# Altium project Interface-Board-v4.0.PrjPcb (part 2 of 2)

## Sheet Stepper-Sheet.SchDoc
size A4; SheetNumber: 3; SheetTotal: 4
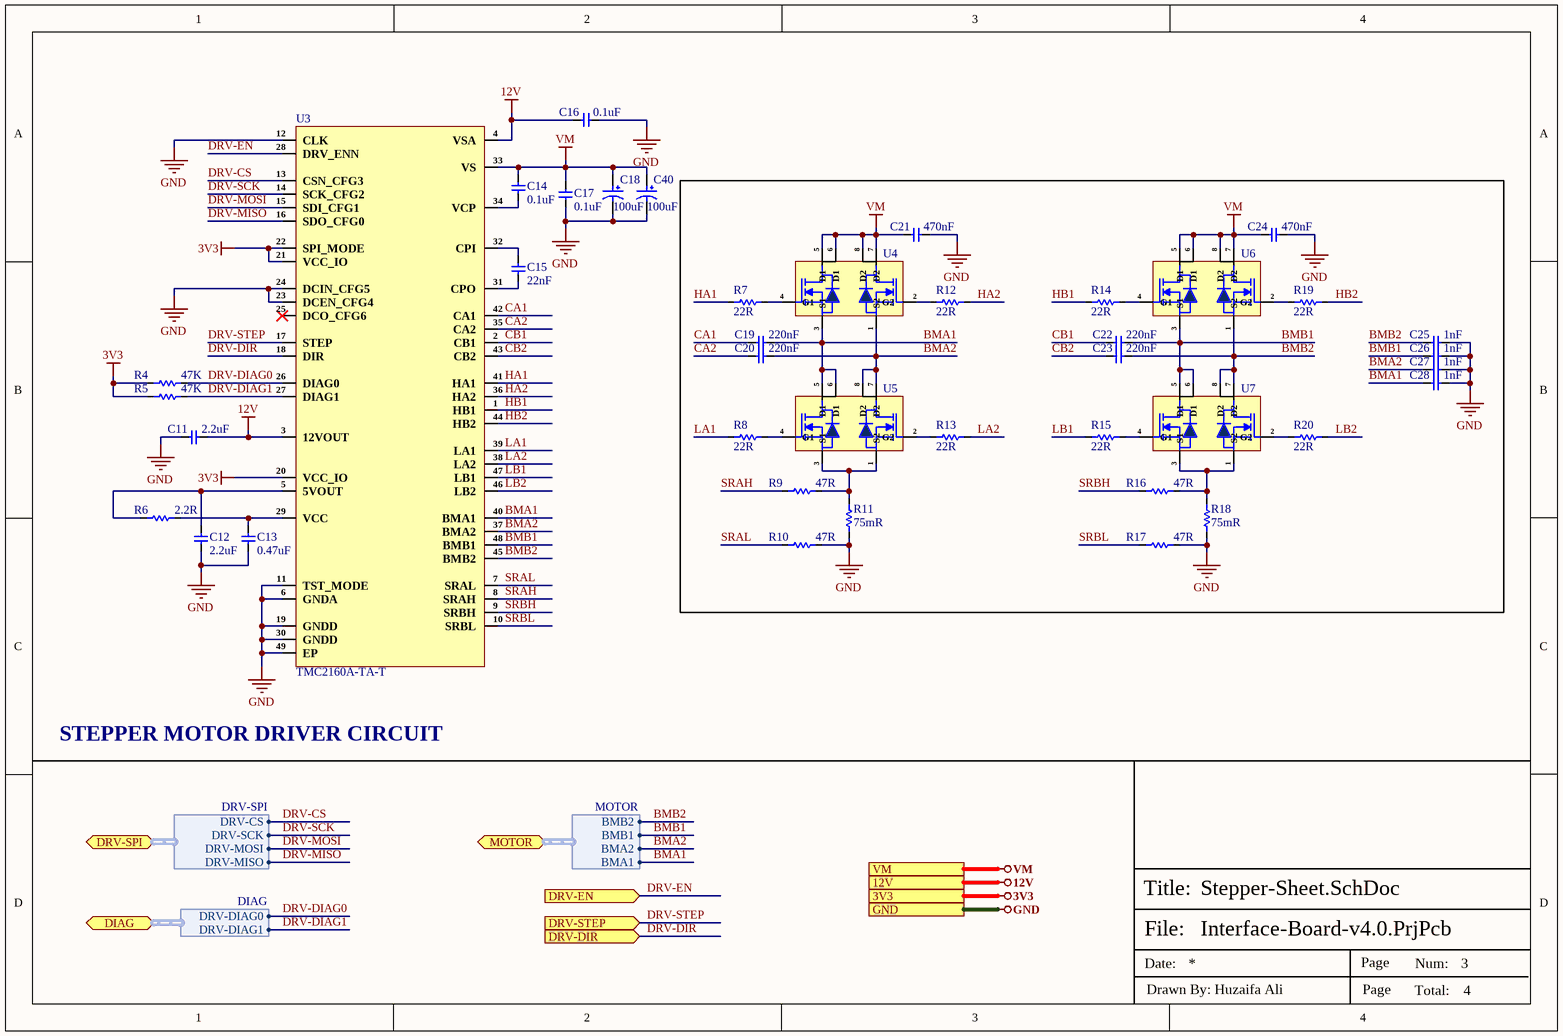
[diagram p2: Stepper-Sheet.SchDoc]

### Parts
C11  2.2uF  [CAP-0603]
C12  2.2uF  [CAP-0603]
C13  0.47uF  [Cap-0603]
C14  0.1uF  [Cap-0603]
C15  22nF  [Cap-0603]
C16  0.1uF  [Cap-0603]
C17  0.1uF  [Cap-0603]
C18  100uF  [RVT1H101M0607]
C19  220nF  [Cap-0603]
C20  220nF  [Cap-0603]
C21  470nF  [Cap-0603]
C22  220nF  [Cap-0603]
C23  220nF  [Cap-0603]
C24  470nF  [Cap-0603]
C25  1nF  [Cap-0603]
C26  1nF  [Cap-0603]
C27  1nF  [Cap-0603]
C28  1nF  [Cap-0603]
C40  100uF  [RVT1H101M0607]
R4  47K  [Res-0201]
R5  47K  [Res-0201]
R6  2.2R  [Res-0402]
R7  22R  [Res-0603]
R8  22R  [Res-0603]
R9  47R  [Res-0603]
R10  47R  [Res-0603]
R11  75mR  [Res-1206]
R12  22R  [Res-0603]
R13  22R  [Res-0603]
R14  22R  [Res-0603]
R15  22R  [Res-0603]
R16  47R  [Res-0603]
R17  47R  [Res-0603]
R18  75mR  [Res-1206]
R19  22R  [Res-0603]
R20  22R  [Res-0603]
U3  TMC2160A-TA-T  [48-TQFP-EP(7x7)]
U4  AOSD62666E  [SOIC-8]  (value not drawn)
U5  AOSD62666E  [SOIC-8]  (value not drawn)
U6  AOSD62666E  [SOIC-8]  (value not drawn)
U7  AOSD62666E  [SOIC-8]  (value not drawn)

### Ports
3V3 (see Top-Sheet[3B], Connector-Sheet[3D], Power-Sheet[3D]), 12V (see Top-Sheet[3B], Connector-Sheet[3D], Power-Sheet[3D]), DIAG (bidir, harness DIAG, see Top-Sheet[3B], Connector-Sheet[1D]), DRV-DIR (in, see Top-Sheet[3B], Connector-Sheet[2D]), DRV-EN (in, see Top-Sheet[3B], Connector-Sheet[2D]), DRV-SPI (bidir, harness DRV-SPI, see Top-Sheet[3B], Connector-Sheet[1D]), DRV-STEP (in, see Top-Sheet[3B], Connector-Sheet[2D]), GND (see Top-Sheet[3B], Connector-Sheet[3D], Power-Sheet[3D]), MOTOR (bidir, harness MOTOR, see Top-Sheet[3B], Connector-Sheet[2D]), VM (see Top-Sheet[3B], Power-Sheet[3D])

### Harnesses
MOTOR: BMB2, BMB1, BMA2, BMA1
DRV-SPI: DRV-CS, DRV-SCK, DRV-MOSI, DRV-MISO
DIAG: DRV-DIAG0, DRV-DIAG1

### Nets
3V3: R4.1 R5.1 U3.20(VCC_IO) U3.21(VCC_IO) U3.22(SPI_MODE) ; port 3V3
12V: C11.2 C16.2 U3.3(12VOUT) U3.4(VSA) ; port 12V
GND: C11.1 C12.1 C13.1 C16.1 C17.1 C18.2 C21.2 C24.2 C25.2 C26.2 C27.2 C28.2 C40.2 R10.2 R11.1 R17.2 R18.1 U3.6(GNDA) U3.11(TST_MODE) U3.12(CLK) U3.19(GNDD) U3.23(DCEN_CFG4) U3.24(DCIN_CFG5) U3.30(GNDD) U3.49(EP) ; port GND
VM: C14.2 C17.2 C18.1 C21.1 C24.1 C40.1 U3.33(VS) U4.5(D1) U4.6(D1) U4.7(D2) U4.8(D2) U6.5(D1) U6.6(D1) U6.7(D2) U6.8(D2) ; port VM
BMA1: C19.2 C28.1 U3.40(BMA1) U4.3(S1) U5.5(D1) U5.6(D1) ; port MOTOR.BMA1
BMA2: C20.2 C27.1 U3.37(BMA2) U4.1(S2) U5.7(D2) U5.8(D2) ; port MOTOR.BMA2
BMB1: C22.2 C26.1 U3.48(BMB1) U6.3(S1) U7.5(D1) U7.6(D1) ; port MOTOR.BMB1
BMB2: C23.2 C25.1 U3.45(BMB2) U6.1(S2) U7.7(D2) U7.8(D2) ; port MOTOR.BMB2
CA1: C19.1 U3.42(CA1)
CA2: C20.1 U3.35(CA2)
CB1: C22.1 U3.2(CB1)
CB2: C23.1 U3.43(CB2)
DRV-CS: U3.13(CSN_CFG3) ; port DRV-SPI.DRV-CS
DRV-DIAG0: R4.2 U3.26(DIAG0) ; port DIAG.DRV-DIAG0
DRV-DIAG1: R5.2 U3.27(DIAG1) ; port DIAG.DRV-DIAG1
DRV-DIR: U3.18(DIR) ; port DRV-DIR
DRV-EN: U3.28(DRV_ENN) ; port DRV-EN
DRV-MISO: U3.16(SDO_CFG0) ; port DRV-SPI.DRV-MISO
DRV-MOSI: U3.15(SDI_CFG1) ; port DRV-SPI.DRV-MOSI
DRV-SCK: U3.14(SCK_CFG2) ; port DRV-SPI.DRV-SCK
DRV-STEP: U3.17(STEP) ; port DRV-STEP
HA1: R7.1 U3.41(HA1)
HA2: R12.2 U3.36(HA2)
HB1: R14.1 U3.1(HB1)
HB2: R19.2 U3.44(HB2)
LA1: R8.1 U3.39(LA1)
LA2: R13.2 U3.38(LA2)
LB1: R15.1 U3.47(LB1)
LB2: R20.2 U3.46(LB2)
SRAH: R9.1 U3.8(SRAH)
SRAL: R10.1 U3.7(SRAL)
SRBH: R16.1 U3.9(SRBH)
SRBL: R17.1 U3.10(SRBL)
NetC12_2: C12.2 R6.1 U3.5(5VOUT)
NetC13_2: C13.2 R6.2 U3.29(VCC)
NetC14_1: C14.1 U3.34(VCP)
NetC15_1: C15.1 U3.31(CPO)
NetC15_2: C15.2 U3.32(CPI)
NetR7_2: R7.2 U4.4(G1)
NetR8_2: R8.2 U5.4(G1)
NetR9_2: R9.2 R11.2 U5.1(S2) U5.3(S1)
NetR12_1: R12.1 U4.2(G2)
NetR13_1: R13.1 U5.2(G2)
NetR14_2: R14.2 U6.4(G1)
NetR15_2: R15.2 U7.4(G1)
NetR16_2: R16.2 R18.2 U7.1(S2) U7.3(S1)
NetR19_1: R19.1 U6.2(G2)
NetR20_1: R20.1 U7.2(G2)

Not connected (* = marked no-connect by the designer): U3 25(DCO_CFG6)*

### Notes on the sheet
- STEPPER MOTOR DRIVER CIRCUIT
- File:
- Title:
- Date:
- Page
- Num:
- Total:
- Drawn By: Huzaifa Ali

### Library data of the parts
C11 C12 = CC0603KRX5R8BB225: CAP CER 2.2UF 25V X5R 0603; Manufacturer: Yageo; Tolerance: 10%; Item Type: Capacitor; Supplier 1: Digi-Key; Manufacturer Part Number: CC0603KRX5R8BB225; Stock 1: 687936; Pricing 1: 1=0.4, 10=0.276, 50=0.1932, 100=0.1656, 500=0.1242, 1000=0.10488 (USD); Mount: Surface Mount; Case/Package: 0603; Case Code (Metric): 1608; Case Code (Imperial): 0603; Weight: 7.1E-05oz; Min Operating Temperature: -55°C; Max Operating Temperature: 85°C; Packaging: Tape and Reel; Capacitance: 2.2uF; Dielectric: X5R; Voltage Rating: 25V; Termination: SMD/SMT; Resistor Type: Ceramic; Voltage Rating (DC): 25V; Package Quantity: 4000; Length: 1.6mm; Width: 0.031inch; Thickness: 0.037inch; Depth: 0.8mm; Radiation Hardening: No; Lead Free: Lead Free; Halogen Free: Halogen Free; RoHS Compliant: Yes; ComponentLink1URL: https://www.verical.com/server-webapp/html/getDatasheet?partID=782757&src-supplier=Verical; ComponentLink1Description: https://www.verical.com/server-webapp/html/getDatasheet?partID=782757&src-supplier=Verical; Supplier Part Number 1: 311-1786-1-ND; LCSC Part Number: C309478
C13 = CC0603KRX5R9BB474: CAP CER 0.47UF 50V X5R 0603; Manufacturer: Yageo; Capacitance: 470nF; Tolerance: 10%; Item Type: Capacitor; Supplier 1: Digi-Key; Manufacturer Part Number: CC0603KRX5R9BB474; RoHS: Yes; Category: Ceramic Capacitors; Stock 1: 15145; Pricing 1: 1=0.45000, 10=0.31400, 50=0.22000, 100=0.18860, 500=0.14144, 1000=0.11944 (USD); Mount: Surface Mount; Case/Package: 0603; Min Operating Temperature: -55°C; Max Operating Temperature: 85°C; Packaging: Tape and Reel; Voltage Rating: 50V; Voltage Rating (DC): 50V; Dielectric: X5R; Length: 0.063inch; Width: 0.031inch; Thickness: 0.035inch; Lead Free: Lead Free; Halogen Free: Halogen Free; RoHS Compliant: Yes; ComponentLink1URL: https://www.mouser.com/ds/2/447/ProductSelectionGuide 2014_Final_2-1131690.pdf?src-supplier=Mouser; ComponentLink1Description: https://www.mouser.com/ds/2/447/ProductSelectionGuide 2014_Final_2-1131690.pdf?src-supplier=Mouser; ComponentLink2URL: http://www.yageo.com/documents/recent/UPY-GPHC_X5R_4V-to-50V_25.pdf?src-supplier=Digi-Key; ComponentLink2Description: http://www.yageo.com/documents/recent/UPY-GPHC_X5R_4V-to-50V_25.pdf?src-supplier=Digi-Key; ComponentLink3URL: http://www.yageo.com/exep/pages/download/literatures/ProductSelectionGuide%202014_Final_2.pdf?src-supplier=Digi-Key; ComponentLink3Description: http://www.yageo.com/exep/pages/download/literatures/ProductSelectionGuide%202014_Final_2.pdf?src-supplier=Digi-Key; Supplier Part Number 1: 311-4047-1-ND; LCSC Part Number: C513651
C14 C16 C17 = CC0603KRX7R0BB104: CAP CER 0.1UF 100V X7R 0603; Manufacturer: Yageo; Capacitance: 100nF; Tolerance: 10%; Item Type: Capacitor; Supplier 1: Digi-Key; Manufacturer Part Number: CC0603KRX7R0BB104; RoHS: Yes; Category: Ceramic Capacitors; Stock 1: 60476; Pricing 1: 1=0.19000, 10=0.13500, 50=0.07680, 100=0.06370, 500=0.04466, 1000=0.03696 (USD); Mount: Surface Mount; Case/Package: 0603; Case Code (Metric): 1608; Case Code (Imperial): 0603; Weight: 7.1E-05oz; Min Operating Temperature: -55°C; Max Operating Temperature: 125°C; Package Quantity: 4000; Voltage Rating: 100V; Packaging: Tape and Reel; Dielectric: X7R; Termination: SMD/SMT; Resistor Type: Ceramic; Voltage Rating (DC): 100V; Series: CC; Length: 0.063inch; Width: 0.031inch; Thickness: 0.035inch; Depth: 0.8mm; Lead Free: Lead Free; RoHS Compliant: Yes; ComponentLink1URL: https://datasheet.ciiva.com/6277/mlccorderingcode-6277030.pdf?src-supplier=Digi-Key; ComponentLink1Description: https://datasheet.ciiva.com/6277/mlccorderingcode-6277030.pdf?src-supplier=Digi-Key; ComponentLink2URL: https://datasheet.ciiva.com/6277/mlccorderingcode-6277081.pdf?src-supplier=Digi-Key; ComponentLink2Description: https://datasheet.ciiva.com/6277/mlccorderingcode-6277081.pdf?src-supplier=Digi-Key; ComponentLink3URL: https://datasheet.ciiva.com/6277/mlccorderingcode-6277082.pdf?src-supplier=Digi-Key; ComponentLink3Description: https://datasheet.ciiva.com/6277/mlccorderingcode-6277082.pdf?src-supplier=Digi-Key; Supplier Part Number 1: 311-1523-1-ND; LCSC Part Number: C113803
C15 = CGA3E2X7R2A223K080AA: CAP CER 0.022UF 100V X7R 0603; Manufacturer: TDK; Tolerance: 10%; Item Type: Capacitor; Supplier 1: Digi-Key; Manufacturer Part Number: CGA3E2X7R2A223K080AA; RoHS: Yes; Category: Ceramic Capacitors; Stock 1: 56079; Pricing 1: 1=0.11000, 10=0.07600, 50=0.04340, 100=0.03590, 500=0.02516, 1000=0.02083 (USD); Mount: Surface Mount; Case/Package: 0603; Case Code (Metric): 1608; Case Code (Imperial): 0603; Weight: 7.1E-05oz; Min Operating Temperature: -55°C; Max Operating Temperature: 125°C; Capacitance: 22nF; Voltage Rating: 100V; Packaging: Tape and Reel; Voltage Rating (DC): 100V; Dielectric: X7R; Termination: SMD/SMT; Series: CGA; Package Quantity: 1; Resistor Type: Ceramic; Length: 1.6mm; Width: 0.031inch; Height: 0.8mm; Thickness: 0.035inch; Depth: 0.8mm; Ratings: AEC-Q200; RoHS Compliant: Yes; REACH SVHC: No SVHC; ComponentLink1URL: https://datasheet.ciiva.com/22725/1735406-22725648.pdf?src-supplier=Element14; ComponentLink1Description: https://datasheet.ciiva.com/22725/1735406-22725648.pdf?src-supplier=Element14; ComponentLink2URL: https://datasheet.ciiva.com/24218/cga3e2x7r2a223k080aa-266292-24218959.pdf?src-supplier=Mouser; ComponentLink2Description: https://datasheet.ciiva.com/24218/cga3e2x7r2a223k080aa-266292-24218959.pdf?src-supplier=Mouser; ComponentLink3URL: https://datasheet.ciiva.com/7975/1807242-7975349.pdf?src-supplier=Element14; ComponentLink3Description: https://datasheet.ciiva.com/7975/1807242-7975349.pdf?src-supplier=Element14; Supplier Part Number 1: 445-5814-1-ND; LCSC Part Number: C2167165
C18 C40 = RVT1H101M0607: 100uF 50V ±20% SMD,D6.3xL7.7mm Aluminum Electrolytic Capacitors - SMD ROHS; Manufacturer: ROQANG; Manufacturer Part Number: RVT1H101M0607; Package: SMD,D6.3xL7.7mm; LCSC Part Number: C3151829; Item Type: Capacitor; ComponentLink1Description: LCSC; ComponentLink1URL: https://www.lcsc.com/product-detail/Aluminum-Electrolytic-Capacitors-SMD_ROQANG-RVT1H101M0607_C3151829.html
C19 C20 C22 C23 = CC0603KRX7R9BB224: CAP CER 0.22 uF, 50 V, ± 10%, X7R, 0603 [1608 Metric]; Manufacturer: Yageo; Material: 4241ConductorMaterial; Voltage Rating: 50V; Item Type: Capacitor; Supplier: Future Electronics; Supplier Part Number: 8068995; Manufacturer Part Number: CC0603KRX7R9BB224; RoHS: Yes; Category: Ceramic Capacitors; Stock: 1468000; Pricing: 4000=0.0134, 12000=0.013, 40000=0.0125, 80000=0.0122, 160000=0.0117 (USD); Mounting Technology: Surface Mount; Case/Package: 0603; Case Code (Imperial): 0603; Case Code (Metric): 1608; Min Operating Temperature: -55°C; Max Operating Temperature: 125°C; Value: 220nF; Packaging: Cut Tape; Tolerance: 10%; Voltage Rating (DC): 50V; Series: CC; Length: 0.063inch; Width: 0.031inch; Height: 900um; Thickness: 0.035inch; Lead Free: Lead Free; Halogen Free: Halogen Free; RoHS Compliant: Yes; ComponentLink1URL: http://www.yageo.com/documents/recent/UPY-GPHC_X7R_6.3V-to-50V_18.pdf?src-supplier=Digi-Key; ComponentLink1Description: http://www.yageo.com/documents/recent/UPY-GPHC_X7R_6.3V-to-50V_18.pdf?src-supplier=Digi-Key; ComponentLink2URL: https://www.yageo.com/upload/media/product/productsearch/datasheet/mlcc/UPY-GPHC_X7R_6.3V-to-50V_18.pdf?src-supplier=Digi-Key; ComponentLink2Description: https://www.yageo.com/upload/media/product/productsearch/datasheet/mlcc/UPY-GPHC_X7R_6.3V-to-50V_18.pdf?src-supplier=Digi-Key; ComponentLink3URL: https://datasheet.octopart.com/CC0603KRX7R9BB224-Yageo-datasheet-140260305.pdf?src-supplier=Newark; ComponentLink3Description: https://datasheet.octopart.com/CC0603KRX7R9BB224-Yageo-datasheet-140260305.pdf?src-supplier=Newark; ComponentLink4URL: https://datasheet.octopart.com/CC0603KRX7R9BB224-Yageo-datasheet-137700082.pdf?src-supplier=Future+Electronics; ComponentLink4Description: https://datasheet.octopart.com/CC0603KRX7R9BB224-Yageo-datasheet-137700082.pdf?src-supplier=Future+Electronics; ComponentLink5URL: https://datasheet.octopart.com/CC0603KRX7R9BB224-Yageo-datasheet-166511530.pdf?src-supplier=Future+Electronics; ComponentLink5Description: https://datasheet.octopart.com/CC0603KRX7R9BB224-Yageo-datasheet-166511530.pdf?src-supplier=Future+Electronics; LCSC Part Number: C107083; ComponentLink6Description: LCSC; ComponentLink6URL: https://www.lcsc.com/product-detail/Multilayer-Ceramic-Capacitors-MLCC-SMD-SMT_YAGEO-CC0603KRX7R9BB224_C107083.html
C21 C24 = CC0603KRX7R9BB474: CAP CER 0.47 uF, 50 V, ± 10%, X7R, 0603 [1608 Metric]; Manufacturer: Yageo; Material: 4241ConductorMaterial; Dielectric: 1511DielectricType; Voltage Rating: 50V; Item Type: Capacitor; Supplier: Future Electronics; Supplier Part Number: 3124150; Manufacturer Part Number: CC0603KRX7R9BB474; RoHS: Yes; Category: Ceramic Capacitors; Stock: 44000; Pricing: 4000=0.0623, 8000=0.0607, 12000=0.0598, 16000=0.0591, 20000=0.0571 (USD); Package: 0603; Min Operating Temperature: -55°C; Max Operating Temperature: 125°C; Value: 470nF; Voltage Rating (DC): 50V; Height: 900um; RoHS Compliant: Yes; Halogen Free: 5694HalogenFree; Lead Free: 5697LeadFree; ComponentLink1URL: https://datasheet.octopart.com/CC0603KRX7R9BB474-Yageo-datasheet-147453679.pdf?src-supplier=Newark; ComponentLink1Description: https://datasheet.octopart.com/CC0603KRX7R9BB474-Yageo-datasheet-147453679.pdf?src-supplier=Newark; ComponentLink2URL: https://datasheet.octopart.com/CC0603KRX7R9BB474-Yageo-datasheet-166511530.pdf?src-supplier=Future+Electronics; ComponentLink2Description: https://datasheet.octopart.com/CC0603KRX7R9BB474-Yageo-datasheet-166511530.pdf?src-supplier=Future+Electronics; ComponentLink3URL: https://datasheet.octopart.com/CC0603KRX7R9BB474-Yageo-datasheet-151948686.pdf?src-supplier=Farnell; ComponentLink3Description: https://datasheet.octopart.com/CC0603KRX7R9BB474-Yageo-datasheet-151948686.pdf?src-supplier=Farnell; LCSC Part Number: C513577; ComponentLink4Description: LCSC; ComponentLink4URL: https://www.lcsc.com/product-detail/Multilayer-Ceramic-Capacitors-MLCC-SMD-SMT_YAGEO-CC0603KRX7R9BB474_C513577.html
C25-C28 = CL10B102KC8NNNC: CAP CER 1nF 100V X7R 0603; Manufacturer: Samsung; Material: Ceramic; Tolerance: 10%; Supplier 1: Avnet; Manufacturer Part Number: CL10B102KC8NNNC; RoHS: Yes; Category: Ceramic Capacitors; Stock 1: 184000; Pricing 1: 4000=0.00988, 8000=0.00987, 16000=0.00986, 24000=0.00985, 32000=0.00984, 40000=0.00982, 400000=0.00981 (USD); Mount: Surface Mount; Case/Package: 0603; Case Code (Metric): 1608; Case Code (Imperial): 0603; Contact Plating: Tin; Min Operating Temperature: -55°C; Max Operating Temperature: 125°C; Capacitance: 1nF; Dielectric: X7R; Packaging: Tape and Reel; Package Quantity: 1; Voltage Rating: 100V; Voltage: 100V; Voltage Rating (DC): 100V; Series: CL; Construction: Flat; Length: 1.6mm; Width: 0.031inch; Height: 0.8mm; Thickness: 0.035inch; Depth: 0.8mm; Radiation Hardening: No; Lead Free: Lead Free; RoHS Compliant: Yes; ComponentLink1URL: https://datasheet.ciiva.com/25799/cl10b102kc8nnnc-25799476.pdf?src-supplier=Digi-Key; ComponentLink1Description: https://datasheet.ciiva.com/25799/cl10b102kc8nnnc-25799476.pdf?src-supplier=Digi-Key; ComponentLink2URL: https://datasheet.ciiva.com/29198/458286-da-01-en-vs-kondensator-0603-29198496.pdf?src-supplier=Conrad; ComponentLink2Description: https://datasheet.ciiva.com/29198/458286-da-01-en-vs-kondensator-0603-29198496.pdf?src-supplier=Conrad; ComponentLink3URL: https://datasheet.ciiva.com/26838/getdatasheetpartid-640779-26838395.pdf?src-supplier=Verical; ComponentLink3Description: https://datasheet.ciiva.com/26838/getdatasheetpartid-640779-26838395.pdf?src-supplier=Verical; ComponentLink4URL: https://datasheet.ciiva.com/26310/mlcc-catalogdownload2013-eng-26310266.pdf?src-supplier=Distrelec; ComponentLink4Description: https://datasheet.ciiva.com/26310/mlcc-catalogdownload2013-eng-26310266.pdf?src-supplier=Distrelec; ComponentLink5URL: https://datasheet.ciiva.com/16199/cl05b104kq5nnnc-16199246.pdf?src-supplier=Future+Electronics; ComponentLink5Description: https://datasheet.ciiva.com/16199/cl05b104kq5nnnc-16199246.pdf?src-supplier=Future+Electronics; Supplier Part Number 1: CL10B102KC8NNNC; LCSC Part Number: C153291
R4 R5 = RC0201FR-0747KL: RES 47K OHM 1% 1/20W 0201; Manufacturer: Yageo; Value: 47kR; Temperature Coefficient: 200ppm/°C; Power Rating: 50mW; Voltage Rating: 25V; Item Type: Resistor; Supplier: Future Electronics; Supplier Part Number: 7316417; Manufacturer Part Number: RC0201FR-0747KL; RoHS: Yes; Category: Chip SMD Resistors; Stock: 1020000; Pricing: 10000=0.0014, 50000=0.0013, 250000=0.0013, 750000=0.0012, 2000000=0.0011 (USD); Case/Package: 0201; Contact Plating: Tin,Matte; Case Code (Metric): 0603; Case Code (Imperial): 0201; Weight: 6E-06oz; Min Operating Temperature: -55°C; Max Operating Temperature: 125°C; Tolerance: 1%; Resistor Type: Thick Film; Packaging: Tape and Reel; Package Quantity: 10000; Number of Terminations: 2; Termination: SMD/SMT; Max Power Dissipation: 50mW; Features: Moisture Resistant; Series: RC; Resistance Tolerance: 1%; Construction: Rectangular; Length: 0.6mm; Width: 0.3mm; Height: 0.01inch; Depth: 0.3mm; Military Standard: Not; RoHS Compliant: Yes; Reach SVHC Compliant: Unknown; Lead Free: 5697LeadFree; ComponentLink1URL: https://datasheet.ciiva.com/7672/1563626-7672232.pdf?src-supplier=Element14; ComponentLink1Description: https://datasheet.ciiva.com/7672/1563626-7672232.pdf?src-supplier=Element14; ComponentLink2URL: https://datasheet.ciiva.com/29710/pyu-r-int-thick-7-29710919.pdf?src-supplier=Digi-Key; ComponentLink2Description: https://datasheet.ciiva.com/29710/pyu-r-int-thick-7-29710919.pdf?src-supplier=Digi-Key; ComponentLink3URL: https://datasheet.ciiva.com/29710/pyu-r-int-thick-7-29710920.pdf?src-supplier=Digi-Key; ComponentLink3Description: https://datasheet.ciiva.com/29710/pyu-r-int-thick-7-29710920.pdf?src-supplier=Digi-Key; ComponentLink4URL: https://datasheet.ciiva.com/25647/pyu-r-int-thick-7-25647310.pdf?src-supplier=Digi-Key; ComponentLink4Description: https://datasheet.ciiva.com/25647/pyu-r-int-thick-7-25647310.pdf?src-supplier=Digi-Key; ComponentLink5URL: https://datasheet.ciiva.com/26829/getdatasheetpartid-422496-26829867.pdf?src-supplier=Verical; ComponentLink5Description: https://datasheet.ciiva.com/26829/getdatasheetpartid-422496-26829867.pdf?src-supplier=Verical; ComponentLink6URL: https://datasheet.ciiva.com/8889/pyu-rc0201-51-rohs-l-8-8889065.pdf?src-supplier=Avnet; ComponentLink6Description: https://datasheet.ciiva.com/8889/pyu-rc0201-51-rohs-l-8-8889065.pdf?src-supplier=Avnet; LCSC Part Number: C138139
R6 = RC0402FR-072R2L: RES 2.2 OHM 1% 1/16W 0402; Manufacturer: Yageo; Power Rating: 63mW; Voltage Rating: 50V; Temperature Coefficient: 200ppm/°C; Supplier 1: Digi-Key; Manufacturer Part Number: RC0402FR-072R2L; RoHS: Yes; Category: Chip SMD Resistors; Stock 1: 828995; Pricing 1: 1=0.10000, 10=0.02300, 100=0.00930, 1000=0.00416, 2500=0.00361, 5000=0.00298 (USD); Case/Package: 0402; Number of Pins: 2; Case Code (Imperial): 0402; Case Code (Metric): 1005; Size Code: 0402; Min Operating Temperature: -55°C; Max Operating Temperature: 155°C; Resistor Type: Thick Film; Resistance: 2.2R; Tolerance: 1%; Packaging: Tape and Reel; Termination: SMD/SMT; Voltage Rating (DC): 50V; Features: Moisture Resistant; Series: RC; Max Power Dissipation: 63mW; Number of Terminations: 2; Resistance Tolerance: 1%; Technology: THICK FILM; Length: 1mm; Width: 0.5mm; Height: 0.32mm; Depth: 0.5mm; RoHS Compliant: Yes; REACH SVHC: No SVHC; Lead Free: Lead Free; ComponentLink1URL: https://datasheet.ciiva.com/11808/0900766b80c66297-11808447.pdf?src-supplier=RSComponents; ComponentLink1Description: https://datasheet.ciiva.com/11808/0900766b80c66297-11808447.pdf?src-supplier=RSComponents; ComponentLink2URL: https://datasheet.ciiva.com/7849/1018594-7849944.pdf?src-supplier=Element14; ComponentLink2Description: https://datasheet.ciiva.com/7849/1018594-7849944.pdf?src-supplier=Element14; ComponentLink3URL: https://datasheet.ciiva.com/7849/1018594-7849945.pdf?src-supplier=Element14; ComponentLink3Description: https://datasheet.ciiva.com/7849/1018594-7849945.pdf?src-supplier=Element14; ComponentLink4URL: https://datasheet.ciiva.com/12668/pyu-rc0402-51-rohs-l-6-r-12668221.pdf?src-supplier=Mouser; ComponentLink4Description: https://datasheet.ciiva.com/12668/pyu-rc0402-51-rohs-l-6-r-12668221.pdf?src-supplier=Mouser; ComponentLink5URL: https://datasheet.ciiva.com/17070/pyu-rc0402-51-rohs-l-6-r-17070495.pdf?src-supplier=Future+Electronics; ComponentLink5Description: https://datasheet.ciiva.com/17070/pyu-rc0402-51-rohs-l-6-r-17070495.pdf?src-supplier=Future+Electronics; Supplier Part Number 1: 311-2.20LRCT-ND; LCSC Part Number: C327251
R7 R8 R12-R15 R19 R20 = RC0603FR-0722RL: RES 22 OHM 1% 1/10W 0603; Manufacturer: Yageo; Temperature Coefficient: 100ppm/°C; Voltage Rating (DC): 50V; Power Rating: 100mW; Item Type: Resistor; Supplier 1: Avnet; Manufacturer Part Number: RC0603FR-0722RL; RoHS: Yes; Category: Chip SMD Resistors; Stock 1: 190000; Pricing 1: 5000=0.00133, 10000=0.00131, 20000=0.00127 (USD); Case/Package: 0603; Number of Pins: 2; Case Code (Metric): 1608; Case Code (Imperial): 0603; Size Code: 0603; Min Operating Temperature: -55°C; Max Operating Temperature: 155°C; Tolerance: 1%; Resistance: 22R; Resistor Type: Thick Film; Packaging: Tape and Reel; Voltage Rating: 50V; Package Quantity: 1; Number of Terminations: 2; Termination: SMD/SMT; Max Power Dissipation: 100mW; Features: Moisture Resistant; Series: RC; Resistance Tolerance: 1%; Technology: THICK FILM; Construction: Rectangular; Length: 0.063inch; Width: 0.031inch; Height: 0.022inch; Depth: 0.8mm; Reach SVHC Compliant: Yes; Lead Free: Lead Free; Military Standard: Not; RoHS Compliant: Yes; ComponentLink1URL: https://datasheet.ciiva.com/11819/0900766b80f96399-11819285.pdf?src-supplier=RSComponents; ComponentLink1Description: https://datasheet.ciiva.com/11819/0900766b80f96399-11819285.pdf?src-supplier=RSComponents; ComponentLink2URL: https://datasheet.ciiva.com/46395/443971-46395032.pdf?src-supplier=Element14; ComponentLink2Description: https://datasheet.ciiva.com/46395/443971-46395032.pdf?src-supplier=Element14; ComponentLink3URL: https://datasheet.ciiva.com/46440/1868787-46440901.pdf?src-supplier=Element14; ComponentLink3Description: https://datasheet.ciiva.com/46440/1868787-46440901.pdf?src-supplier=Element14; ComponentLink4URL: https://datasheet.ciiva.com/2454/pyu-r-int-thick-7-2454355.pdf?src-supplier=Digi-Key; ComponentLink4Description: https://datasheet.ciiva.com/2454/pyu-r-int-thick-7-2454355.pdf?src-supplier=Digi-Key; ComponentLink5URL: https://datasheet.ciiva.com/2454/pyu-r-int-thick-7-2454356.pdf?src-supplier=Digi-Key; ComponentLink5Description: https://datasheet.ciiva.com/2454/pyu-r-int-thick-7-2454356.pdf?src-supplier=Digi-Key; ComponentLink6URL: https://datasheet.ciiva.com/2454/pyu-r-int-thick-7-2454354.pdf?src-supplier=Digi-Key; ComponentLink6Description: https://datasheet.ciiva.com/2454/pyu-r-int-thick-7-2454354.pdf?src-supplier=Digi-Key; Supplier Part Number 1: RC0603FR-0722RL; LCSC Part Number: C107701
R9 R10 R16 R17 = RC0603FR-0747RL: RES SMD 47OHM 0.1W 0603; Manufacturer: Yageo; Tolerance: 1%; Power Rating: 100mW; Voltage Rating (DC): 50V; Temperature Coefficient: 100ppm/°C; Voltage Rating: 75V; Supplier 1: Digi-Key; Manufacturer Part Number: RC0603FR-0747RL; RoHS: Yes; Category: Chip SMD Resistors; Stock 1: 596562; Pricing 1: 1=0.10000, 10=0.02400, 100=0.00970, 1000=0.00436, 2500=0.00378 (USD); Case/Package: 0603; Number of Pins: 2; Case Code (Imperial): 0603; Case Code (Metric): 1608; Weight: 7.1E-05oz; Size Code: 0603; Min Operating Temperature: -55°C; Max Operating Temperature: 155°C; Resistance: 47R; Packaging: Tape and Reel; Package Quantity: 1; Termination: SMD/SMT; Resistor Type: Thick Film; Number of Terminations: 2; Max Power Dissipation: 100mW; Features: Moisture Resistant; Series: RC; Construction: Rectangular; Resistance Tolerance: 1%; Length: 1.6mm; Width: 0.8mm; Height: 0.022inch; Depth: 0.8mm; REACH SVHC: Unknown; Lead Free: Lead Free; Military Standard: Not; RoHS Compliant: Yes; ComponentLink1URL: https://datasheet.ciiva.com/2453/pyu-r-int-thick-7-2453922.pdf?src-supplier=Digi-Key; ComponentLink1Description: https://datasheet.ciiva.com/2453/pyu-r-int-thick-7-2453922.pdf?src-supplier=Digi-Key; ComponentLink2URL: https://datasheet.ciiva.com/2453/pyu-r-int-thick-7-2453923.pdf?src-supplier=Digi-Key; ComponentLink2Description: https://datasheet.ciiva.com/2453/pyu-r-int-thick-7-2453923.pdf?src-supplier=Digi-Key; ComponentLink3URL: https://datasheet.ciiva.com/2453/pyu-r-int-thick-7-2453924.pdf?src-supplier=Digi-Key; ComponentLink3Description: https://datasheet.ciiva.com/2453/pyu-r-int-thick-7-2453924.pdf?src-supplier=Digi-Key; ComponentLink4URL: https://datasheet.ciiva.com/7746/443971-7746363.pdf?src-supplier=Element14; ComponentLink4Description: https://datasheet.ciiva.com/7746/443971-7746363.pdf?src-supplier=Element14; ComponentLink5URL: https://datasheet.ciiva.com/7746/443971-7746364.pdf?src-supplier=Element14; ComponentLink5Description: https://datasheet.ciiva.com/7746/443971-7746364.pdf?src-supplier=Element14; ComponentLink6URL: https://datasheet.ciiva.com/46440/1868787-46440908.pdf?src-supplier=Element14; ComponentLink6Description: https://datasheet.ciiva.com/46440/1868787-46440908.pdf?src-supplier=Element14; Supplier Part Number 1: 311-47.0HRCT-ND; LCSC Part Number: C114623
R11 R18 = ERJ-8BWFR075V: RES 0.075 OHM 1% 1W 1206; Manufacturer: Panasonic; Temperature Coefficient: 100ppm/°C; Item Type: Resistor Current Sense; Supplier: Mouser; Supplier Part Number: 667-ERJ-8BWFR075V; Manufacturer Part Number: ERJ-8BWFR075V; RoHS: Yes; Category: Chip SMD Resistors; Stock: 148; Pricing: 1=0.72, 10=0.385, 50=0.385, 100=0.337, 1000=0.215, 10000=0.178 (USD); Mounting Technology: Surface Mount; Case/Package: 1206; Pins: 2; Case Code (Metric): 3216; Case Code (Imperial): 1206; Contact Plating: Tin; Min Operating Temperature: -55°C; Max Operating Temperature: 155°C; Tolerance: 1%; Power Rating: 1W; Value: 75mR; Packaging: Tape and Reel; Package Quantity: 5000; Resistor Type: Thick Film; Number of Terminations: 2; Termination: SMD/SMT; Max Power Dissipation: 1W; Features: Automotive AEC-Q200; Series: ERJ; Technology: THICK FILM; Resistance Tolerance: 1%; Length: 3.2mm; Width: 1.6mm; Height: 0.65mm; Depth: 1.6mm; Ratings: AEC-Q200; Lead Free: Lead Free; ComponentLink1URL: https://datasheet.ciiva.com/11810/0900766b8126441d-11810144.pdf?src-supplier=Rs; ComponentLink1Description: https://datasheet.ciiva.com/11810/0900766b8126441d-11810144.pdf?src-supplier=Rs; ComponentLink2URL: https://datasheet.ciiva.com/5901/1662788-5901709.pdf?src-supplier=Farnell; ComponentLink2Description: https://datasheet.ciiva.com/5901/1662788-5901709.pdf?src-supplier=Farnell; ComponentLink3URL: https://datasheet.ciiva.com/7943/1662788-7943643.pdf?src-supplier=Element14; ComponentLink3Description: https://datasheet.ciiva.com/7943/1662788-7943643.pdf?src-supplier=Element14; ComponentLink4URL: https://datasheet.ciiva.com/5901/1662788-5901708.pdf?src-supplier=Farnell; ComponentLink4Description: https://datasheet.ciiva.com/5901/1662788-5901708.pdf?src-supplier=Farnell; ComponentLink5URL: https://datasheet.ciiva.com/24025/aoa0000ce3-72189-24025850.pdf?src-supplier=Mouser; ComponentLink5Description: https://datasheet.ciiva.com/24025/aoa0000ce3-72189-24025850.pdf?src-supplier=Mouser; ComponentLink6URL: https://datasheet.ciiva.com/9187/aoa0000ce3-9187670.pdf?src-supplier=Avnet; ComponentLink6Description: https://datasheet.ciiva.com/9187/aoa0000ce3-9187670.pdf?src-supplier=Avnet; ComponentLink7URL: https://datasheet.ciiva.com/30147/6aoa0000ce3-30147930.pdf?src-supplier=Onlinecomponents.com; ComponentLink7Description: https://datasheet.ciiva.com/30147/6aoa0000ce3-30147930.pdf?src-supplier=Onlinecomponents.com; LCSC Part Number: C2909897
U3 = TMC2160A-TA-T: IC MTR DRV BIPOLAR 10-50V 48TQFP; Manufacturer: Trinamic; Supplier: Mouser; Supplier Part Number: 700-TMC2160A-TA-T; Manufacturer Part Number: TMC2160A-TA-T; RoHS: Yes; Stock: 9328; Pricing: 1=6.21, 10=5.28, 50=5.28, 100=4.57, 1000=3.48, 10000=3.11 (USD); LCSC Part Number: C465948; Item Type: IC
U4-U7 = AOSD62666E: MOSFET 2N-CH 60V 9.5A 8SOIC; Manufacturer: Alpha & Omega Semiconductor; Supplier: Digi-Key; Supplier Part Number: 785-1792-1-ND; Manufacturer Part Number: AOSD62666E; RoHS: No; Category: Transistors; Stock: 12025; Pricing: 1=1.11, 10=0.911, 100=0.7084, 500=0.60046, 1000=0.48914 (USD); ComponentLink1URL: http://www.aosmd.com/res/data_sheets/AOSD62666E.pdf?src-supplier=Digi-Key; ComponentLink1Description: http://www.aosmd.com/res/data_sheets/AOSD62666E.pdf?src-supplier=Digi-Key; ComponentLink2URL: https://datasheet.octopart.com/AOSD62666E-Alpha-%26-Omega-Semiconductor-datasheet-136498378.pdf?src-supplier=LKR; ComponentLink2Description: https://datasheet.octopart.com/AOSD62666E-Alpha-%26-Omega-Semiconductor-datasheet-136498378.pdf?src-supplier=LKR; LCSC Part Number: C541719; Item Type: MOSFET

## Sheet Connector-Sheet.SchDoc
size A4; SheetNumber: 4; SheetTotal: 4
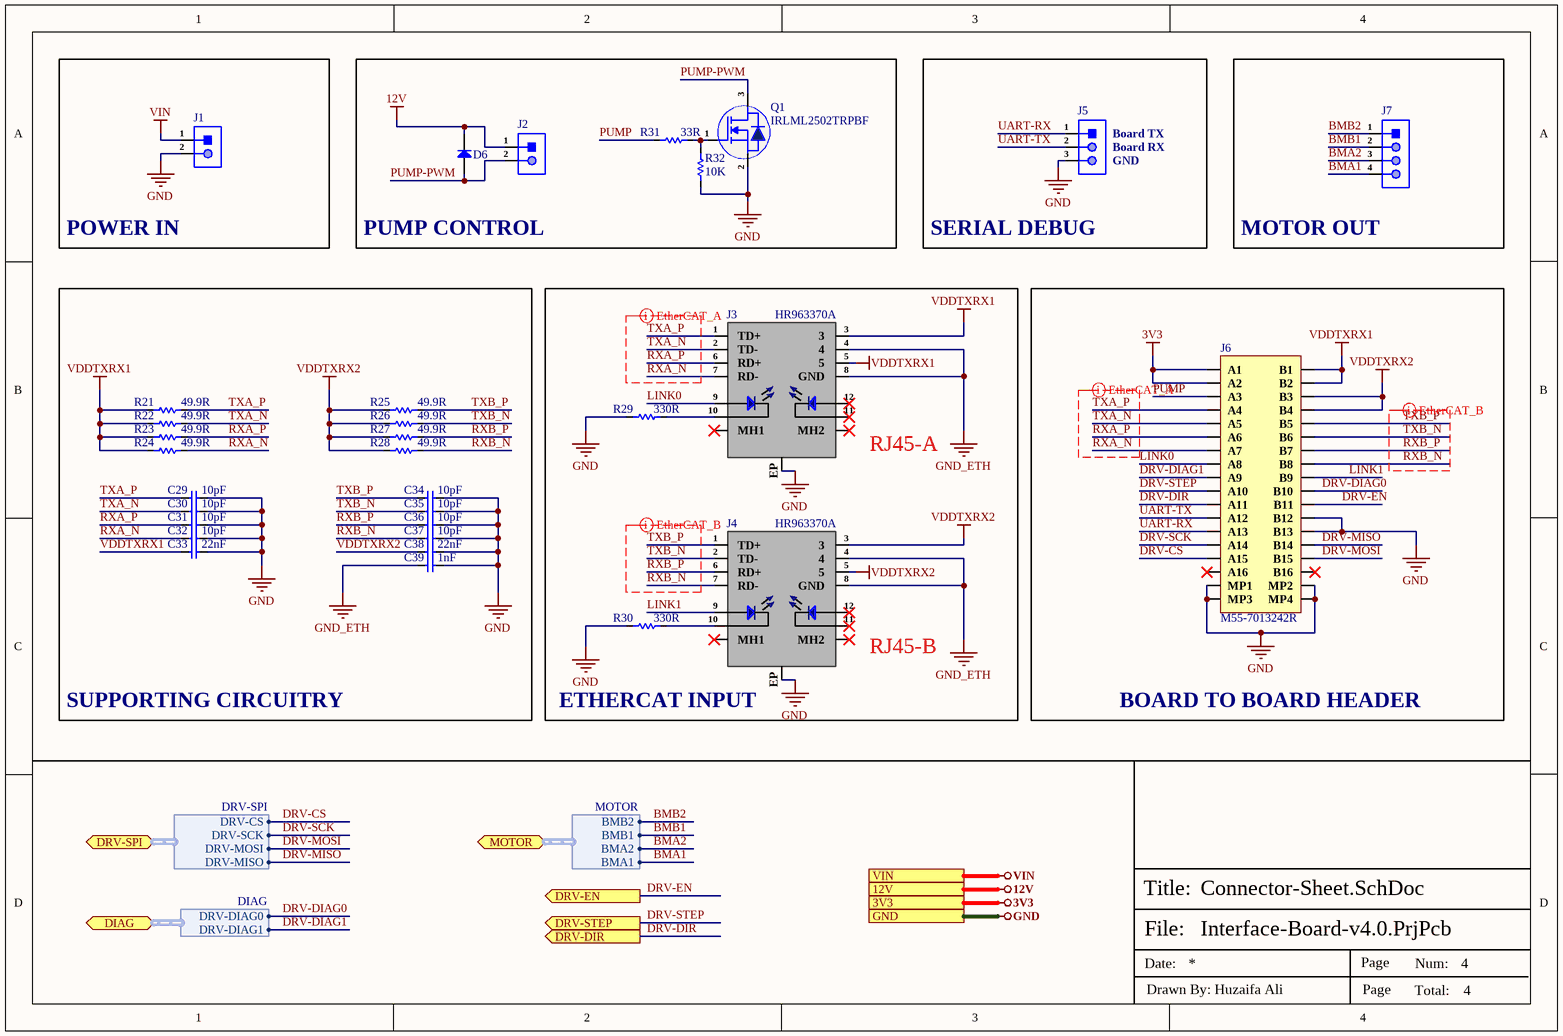
[diagram p3: Connector-Sheet.SchDoc]

### Parts
C29  10pF  [CAP-0201]
C30  10pF  [CAP-0201]
C31  10pF  [CAP-0201]
C32  10pF  [CAP-0201]
C33  22nF  [CAP-0201]
C34  10pF  [CAP-0201]
C35  10pF  [CAP-0201]
C36  10pF  [CAP-0201]
C37  10pF  [CAP-0201]
C38  22nF  [CAP-0201]
C39  1nF  [CAP-0201]
D6  1N4148WT  [SOD-523F]  (value not drawn)
J1  X6511WV-02H-C60D30  [HDR1X2_]  (value not drawn)
J2  X6511WV-02H-C60D30  [HDR1X2_]  (value not drawn)
J3  HR963370A  [HR963370A]
J4  HR963370A  [HR963370A]
J5  X6511WVS-03H-C60D48R1  [HDR1X3-SMD]  (value not drawn)
J6  M55-7013242R  [M55-7013242R]
J7  X6511WV-04H-C60D30  [HDR1X4_]  (value not drawn)
Q1  IRLML2502TRPBF  [SOT-23]
R21  49.9R  [Res-0201]
R22  49.9R  [Res-0201]
R23  49.9R  [Res-0201]
R24  49.9R  [Res-0201]
R25  49.9R  [Res-0201]
R26  49.9R  [Res-0201]
R27  49.9R  [Res-0201]
R28  49.9R  [Res-0201]
R29  330R  [Res-0201]
R30  330R  [Res-0201]
R31  33R  [Res-0201]
R32  10K  [Res-0201]

### Blocks framed on the sheet
POWER IN: J1
PUMP CONTROL: D6 J2 Q1 R31 R32
SERIAL DEBUG: J5
MOTOR OUT: J7
SUPPORTING CIRCUITRY: C29-C39 R21-R28
BOARD TO BOARD HEADER: J6

### Ports
3V3 (see Top-Sheet[2B], Power-Sheet[3D], Stepper-Sheet[3D]), 12V (see Top-Sheet[2B], Power-Sheet[3D], Stepper-Sheet[3D]), DIAG (bidir, harness DIAG, see Top-Sheet[3B], Stepper-Sheet[1D]), DRV-DIR (out, see Top-Sheet[3B], Stepper-Sheet[2D]), DRV-EN (out, see Top-Sheet[3B], Stepper-Sheet[2D]), DRV-SPI (bidir, harness DRV-SPI, see Top-Sheet[3B], Stepper-Sheet[1D]), DRV-STEP (out, see Top-Sheet[3B], Stepper-Sheet[2D]), GND (see Top-Sheet[2B], Power-Sheet[3D], Stepper-Sheet[3D]), MOTOR (bidir, harness MOTOR, see Top-Sheet[3B], Stepper-Sheet[2D]), VIN (see Top-Sheet[2B], Power-Sheet[3D])

### Harnesses
MOTOR: BMB2, BMB1, BMA2, BMA1
DRV-SPI: DRV-CS, DRV-SCK, DRV-MOSI, DRV-MISO
DIAG: DRV-DIAG0, DRV-DIAG1

### Nets
3V3: J6.A1 J6.A2 ; port 3V3
12V: D6.2(K) J2.1 ; port 12V
GND: C29.2 C30.2 C31.2 C32.2 C33.2 C34.2 C35.2 C36.2 C37.2 C38.2 C39.2 J1.2 J3.EP J4.EP J5.3 J6.B12 J6.B13 J6.MP1 J6.MP2 J6.MP3 J6.MP4 Q1.2(S) R29.1 R30.1 R32.1 ; port GND
GND_ETH: C39.1 J3.4 J3.8(GND) J4.4 J4.8(GND)
VDDTXRX1: C33.1 J3.3 J3.5 J6.B1 J6.B2 R21.1 R22.1 R23.1 R24.1
VDDTXRX2: C38.1 J4.3 J4.5 J6.B3 J6.B4 R25.1 R26.1 R27.1 R28.1
VIN: J1.1 ; port VIN
BMA1: J7.4 ; port MOTOR.BMA1
BMA2: J7.3 ; port MOTOR.BMA2
BMB1: J7.2 ; port MOTOR.BMB1
BMB2: J7.1 ; port MOTOR.BMB2
DRV-CS: J6.A15 ; port DRV-SPI.DRV-CS
DRV-DIAG0: J6.B10 ; port DIAG.DRV-DIAG0
DRV-DIAG1: J6.A9 ; port DIAG.DRV-DIAG1
DRV-DIR: J6.A11 ; port DRV-DIR
DRV-EN: J6.B11 ; port DRV-EN
DRV-MISO: J6.B14 ; port DRV-SPI.DRV-MISO
DRV-MOSI: J6.B15 ; port DRV-SPI.DRV-MOSI
DRV-SCK: J6.A14 ; port DRV-SPI.DRV-SCK
DRV-STEP: J6.A10 ; port DRV-STEP
LINK0: J3.9(ANODE) J6.A8
LINK1: J4.9(ANODE) J6.B9
PUMP: J6.A3 R31.1
PUMP-PWM: D6.1(A) J2.2 Q1.3(D)
RXA_N: C32.1 J3.7(RD-) J6.A7 R24.2
RXA_P: C31.1 J3.6(RD+) J6.A6 R23.2
RXB_N: C37.1 J4.7(RD-) J6.B8 R28.2
RXB_P: C36.1 J4.6(RD+) J6.B7 R27.2
TXA_N: C30.1 J3.2(TD-) J6.A5 R22.2
TXA_P: C29.1 J3.1(TD+) J6.A4 R21.2
TXB_N: C35.1 J4.2(TD-) J6.B6 R26.2
TXB_P: C34.1 J4.1(TD+) J6.B5 R25.2
UART-RX: J5.1 J6.A13
UART-TX: J5.2 J6.A12
NetJ3_10: J3.10(CATHODE) R29.2
NetJ4_10: J4.10(CATHODE) R30.2
NetQ1_1: Q1.1(G) R31.2 R32.2

Not connected (* = marked no-connect by the designer): J3 11(CATHODE)* 12(ANODE_)* MH1* MH2*; J4 11(CATHODE)* 12(ANODE_)* MH1* MH2*; J6 A16* B16*

### Layout directives
differential pair; differential pair class EtherCAT_A_Lines; net class EtherCAT_A; rule Matched Net Lengths [Tolerance = 20mil]; rule Impedance Constraint [Min = 85.00    Max = 95.00    ]: RXA_N, RXA_P, TXA_N, TXA_P
differential pair; differential pair class EtherCAT_B_Lines; net class EtherCAT_B; rule Matched Net Lengths [Tolerance = 20mil]; rule Impedance Constraint [Min = 85.00    Max = 95.00    ]: RXB_N, RXB_P, TXB_N, TXB_P

### Notes on the sheet
- (near J5) Board TX
- (near J5) Board RX
- (near J5) GND
- (near J3) RJ45-A
- (near J4) RJ45-B
- (near J4) ETHERCAT INPUT
- File:
- Title:
- Date:
- Page
- Num:
- Total:
- Drawn By: Huzaifa Ali

### Library data of the parts
C29-C32 C34-C37 = CGA1A2C0G1E100D030BA: CAP CER 10PF 25V C0G 0201; Manufacturer: TDK; Item Type: Capacitor; Supplier 1: Digi-Key; Manufacturer Part Number: CGA1A2C0G1E100D030BA; RoHS: Yes; Category: Ceramic Capacitors; Stock 1: 28695; Pricing 1: 1=0.11000, 10=0.07900, 50=0.04340, 100=0.03540, 500=0.02530, 1000=0.01987, 2500=0.01807, 5000=0.01662 (USD); Mount: Surface Mount; Case/Package: 0201; Case Code (Imperial): 0201; Case Code (Metric): 0603; Weight: 6E-06oz; Min Operating Temperature: -55°C; Max Operating Temperature: 125°C; Packaging: Tape and Reel; Capacitance: 10pF; Voltage Rating: 25V; Termination: SMD/SMT; Voltage Rating (DC): 25V; Package Quantity: 1; Dielectric: C0G; Resistor Type: Ceramic; Series: CGA; Length: 0.6mm; Width: 0.3mm; Height: 0.3mm; Thickness: 0.013inch; Depth: 0.3mm; Ratings: AEC-Q200; RoHS Compliant: Yes; ComponentLink1URL: https://datasheet.ciiva.com/24220/cga1a2c0g1e100d030ba-271838-24220873.pdf?src-supplier=Mouser; ComponentLink1Description: https://datasheet.ciiva.com/24220/cga1a2c0g1e100d030ba-271838-24220873.pdf?src-supplier=Mouser; Supplier Part Number 1: 445-9023-1-ND; LCSC Part Number: C2168728
C33 C38 = CC0201KRX5R8BB223: CAP CER 0.022UF 25V X5R 0201; Item Type: Capacitor; Material: 4241ConductorMaterial; Dielectric: 1537DielectricType; LCSC Part Number: C505472; ComponentLink1Description: LCSC; Supplier: Future Electronics; Supplier Part Number: 9164548; RoHS: Yes; Category: Ceramic Capacitors; Stock: 15000; Pricing: 15000=0.0018, 60000=0.0017, 225000=0.0016, 375000=0.0016, 750000=0.0015 (USD); Case/Package: 344Case; Min Operating Temperature: -55°C; Max Operating Temperature: 85°C; Value: 22nF; Voltage Rating: 25V; Voltage Rating (DC): 25V; Height: 330um; Halogen Free: 5694HalogenFree; Lead Free: 5697LeadFree
C39 = CC0201KRX5R8BB102: CAP CER 1000PF 25V X5R 0201; Manufacturer: Yageo; Tolerance: 10%; Supplier 1: Mouser; Manufacturer Part Number: CC0201KRX5R8BB102; RoHS: Yes; Category: Ceramic Capacitors; Stock 1: 54104; Pricing 1: 1=0.10000, 10=0.02600, 50=0.02600, 100=0.01100, 1000=0.00700, 10000=0.00500 (USD); Mount: Surface Mount; Case/Package: 0201; Min Operating Temperature: -55°C; Max Operating Temperature: 85°C; Packaging: Tape and Reel; Capacitance: 1nF; Voltage Rating: 25V; Voltage Rating (DC): 25V; Dielectric: X5R; Length: 0.024inch; Width: 0.012inch; Thickness: 0.013inch; Lead Free: Lead Free; Halogen Free: Halogen Free; RoHS Compliant: Yes; ComponentLink1URL: http://www.yageo.com/documents/recent/UPY-GPHC_X5R_4V-to-50V_25.pdf?src-supplier=Digi-Key; ComponentLink1Description: http://www.yageo.com/documents/recent/UPY-GPHC_X5R_4V-to-50V_25.pdf?src-supplier=Digi-Key; ComponentLink2URL: https://www.yageo.com/upload/media/product/productsearch/datasheet/mlcc/UPY-GPHC_X5R_4V-to-50V_25.pdf?src-supplier=Digi-Key; ComponentLink2Description: https://www.yageo.com/upload/media/product/productsearch/datasheet/mlcc/UPY-GPHC_X5R_4V-to-50V_25.pdf?src-supplier=Digi-Key; ComponentLink3URL: http://www.yageo.com/exep/pages/download/literatures/ProductSelectionGuide%202014_Final_2.pdf?src-supplier=Digi-Key; ComponentLink3Description: http://www.yageo.com/exep/pages/download/literatures/ProductSelectionGuide%202014_Final_2.pdf?src-supplier=Digi-Key; Supplier Part Number 1: 603-CC0201KR8BB102; LCSC Part Number: C541213
D6 = 1N4148WT: DIODE GEN PURP 75V 200MA SOD523F; Manufacturer: ON Semiconductor / Fairchild; Recovery Time: 4ns; Forward Current: 300mA; Max Reverse Current: 5uA; Power Dissipation: 200mW; Max Forward Surge Current (Ifsm): 4A; Element Configuration: Single; Supplier 1: Future Electronics; Manufacturer Part Number: 1N4148WT; RoHS: Yes; Category: Rectifier Diodes; Stock 1: 30; Pricing 1: 1=0.0305, 20=0.0267, 125=0.0246, 750=0.0227, 4000=0.0204 (USD); Mounting Technology: Surface Mount; Pins: 2; Weight: 0.01g; Contact Plating: Tin,Matte; Min Operating Temperature: -55°C; Max Operating Temperature: 150°C; Packaging: Tape and Reel; Package Quantity: 1; Series: -; Reverse Recovery Time: 4ns; Max Repetitive Reverse Voltage (Vrrm): 75V; Average Rectified Current: 200mA; Max Reverse Voltage (DC): 75V; Reverse Recovery Time-Max: 4ns; Length: 1.3mm; Width: 0.9mm; Height: 0.7mm; Radiation Hardening: No; RoHS Compliant: Yes; Lead Free: Lead Free; Reach SVHC Compliant: No; ComponentLink1URL: https://datasheet.ciiva.com/16744/1n4148wt-16744972.pdf?src-supplier=Future+Electronics; ComponentLink1Description: https://datasheet.ciiva.com/16744/1n4148wt-16744972.pdf?src-supplier=Future+Electronics; ComponentLink2URL: https://datasheet.ciiva.com/30479/0900766b810e1cd4-30479226.pdf?src-supplier=Rs; ComponentLink2Description: https://datasheet.ciiva.com/30479/0900766b810e1cd4-30479226.pdf?src-supplier=Rs; ComponentLink3URL: https://datasheet.ciiva.com/15208/getdatasheetpartid-146392-15208359.pdf?src-supplier=Verical; ComponentLink3Description: https://datasheet.ciiva.com/15208/getdatasheetpartid-146392-15208359.pdf?src-supplier=Verical; ComponentLink4URL: https://datasheet.ciiva.com/916/1n914bwt-916865.pdf?src-supplier=Digi-Key; ComponentLink4Description: https://datasheet.ciiva.com/916/1n914bwt-916865.pdf?src-supplier=Digi-Key; ComponentLink5URL: https://datasheet.ciiva.com/916/1n914bwt-916866.pdf?src-supplier=Digi-Key; ComponentLink5Description: https://datasheet.ciiva.com/916/1n914bwt-916866.pdf?src-supplier=Digi-Key; ComponentLink6URL: https://datasheet.ciiva.com/916/1n914bwt-916864.pdf?src-supplier=Digi-Key; ComponentLink6Description: https://datasheet.ciiva.com/916/1n914bwt-916864.pdf?src-supplier=Digi-Key; Supplier Part Number 1: 6145918; LCSC Part Number: C232841; Item Type: Diode
J1 J2 = X6511WV-02H-C60D30: Gold 250V 3A Straight Square Pins 2.5mm 2P 260℃ 6mm -40℃~+105℃ 3mm 2.54mm Plugin Black Brass 1x2P Plugin,P=2.54mm Pin Headers ROHS; Manufacturer: XKB; Item Type: Male Header; Manufacturer Part Number: X6511WV-02H-C60D30; Package: Plugin,P=2.54mm; LCSC Part Number: C706874; ComponentLink1Description: LCSC; ComponentLink1URL: https://www.lcsc.com/product-detail/Pin-Headers_XKB-Connectivity-X6511WV-02H-C60D30_C706874.html
J3 J4 = HR963370A: 1x1 Port Tab upright Surface Mount RJ45 Connector with Integrated Magnetics and LED; Manufacturer: Hanrun; Item Type: Ethernet Connector; Manufacturer Part Number: HR963370A; Package: Custom
J5 = X6511WVS-03H-C60D48R1: Gold 250V 3A Brick nogging Square Pins 2.5mm 3P 260℃ 6mm -40℃~+105℃ 2.54mm Plugin Black Brass 1x3P SMD,P=2.54mm(交错脚) Pin Headers ROHS; Manufacturer: XKB Connectivity; Item Type: Male Header; Manufacturer Part Number: X6511WVS-03H-C60D48R1; Package: SMD,P=2.54mm; LCSC Part Number: C780061; ComponentLink1Description: LCSC; ComponentLink1URL: https://www.lcsc.com/product-detail/Pin-Headers_XKB-Connectivity-X6511WVS-03H-C60D48R1_C780061.html
J6 = M55-7013242R: CONN HDR 1.27MM SMD 32POS; Manufacturer: Harwin; Item Type: Connector Header; Supplier: Mouser; Supplier Part Number: 855-M55-7013242R; Manufacturer Part Number: M55-7013242R; RoHS: Yes; Category: Connectors; Stock: 1347; Pricing: 1=2.13, 10=1.82, 50=1.82, 100=1.63, 1000=1.17, 10000=1.07 (USD)
J7 = X6511WV-04H-C60D30: Gold 250V 3A Straight Square Pins 2.5mm 4P 260℃ 6mm -40℃~+105℃ 3mm 2.54mm Plugin Black Brass 1x4P Plugin,P=2.54mm Pin Headers ROHS; Manufacturer: XKB; Item Type: Male Header; ComponentLink1Description: LCSC; ComponentLink1URL: https://www.lcsc.com/product-detail/Pin-Headers_XKB-Connectivity-X6511WV-04H-C60D30_C706876.html; Manufacturer Part Number: X6511WV-04H-C60D30; Package: Plugin,P=2.54mm; LCSC Part Number: C706876
Q1 = IRLML2502TRPBF: MOSFET N-CH 20V 4.2A SOT23; Manufacturer: Infineon Technologies; Manufacturer Part Number: IRLML2502TRPBF; Package: SOT-23; ComponentLink2URL: https://www.lcsc.com/product-detail/MOSFETs_Infineon-Technologies-IRLML2502TRPBF_C2589.html; ComponentLink2Description: LCSC; LCSC Part Number: C2589; Item Type: Mosfet
R21-R28 = RC0201FR-0749R9L: RES SMD 49.9 OHM 1% 1/20W 0201; Manufacturer: Yageo; Power Rating: 50mW; Voltage Rating: 25V; Temperature Coefficient: 200ppm/°C; Item Type: Resistor; Supplier 1: Avnet; Manufacturer Part Number: RC0201FR-0749R9L; RoHS: Yes; Category: Chip SMD Resistors; Stock 1: 1020000; Pricing 1: 10000=0.00128 (USD); Case/Package: 0201; Case Code (Imperial): 0201; Case Code (Metric): 0603; Size Code: 0201; Min Operating Temperature: -55°C; Max Operating Temperature: 125°C; Packaging: Tape and Reel; Resistance: 49.9R; Tolerance: 1%; Resistor Type: Thick Film; Number of Terminations: 2; Termination: SMD/SMT; Max Power Dissipation: 50mW; Features: Moisture Resistant; Series: RC; Construction: Rectangular; Length: 0.6mm; Width: 0.012inch; Height: 0.01inch; Depth: 0.3mm; Military Standard: Not; Lead Free: Lead Free; RoHS Compliant: Yes; ComponentLink1URL: http://www.yageo.com/documents/recent/PYu-RC0201_51_RoHS_L_(8).pdf?src-supplier=Mouser; ComponentLink1Description: http://www.yageo.com/documents/recent/PYu-RC0201_51_RoHS_L_(8).pdf?src-supplier=Mouser; ComponentLink2URL: http://www.yageo.com/documents/recent/PYu-RC0201_51_RoHS_L_(8).pdf?src-supplier=Future+Electronics; ComponentLink2Description: http://www.yageo.com/documents/recent/PYu-RC0201_51_RoHS_L_(8).pdf?src-supplier=Future+Electronics; ComponentLink3URL: http://www.yageo.com/documents/recent/PYu-RC_Group_51_RoHS_L_10.pdf?src-supplier=Digi-Key; ComponentLink3Description: http://www.yageo.com/documents/recent/PYu-RC_Group_51_RoHS_L_10.pdf?src-supplier=Digi-Key; ComponentLink4URL: http://www.yageo.com/documents/recent/PYu-RC_Group_51_RoHS_L_9.pdf?src-supplier=Digi-Key; ComponentLink4Description: http://www.yageo.com/documents/recent/PYu-RC_Group_51_RoHS_L_9.pdf?src-supplier=Digi-Key; Supplier Part Number 1: RC0201FR-0749R9L; LCSC Part Number: C155744
R29 R30 = RC0201DR-07330RL: RES 330 OHM 0.5% 1/20W 0201; Manufacturer: Yageo; Max Power Dissipation: 50mW; Temperature Coefficient: 200ppm/°C; Item Type: Resistor; Supplier 1: Digi-Key; Manufacturer Part Number: RC0201DR-07330RL; RoHS: Yes; Category: Chip SMD Resistors; Pricing 1: 10000=0.02267 (USD); Case/Package: 0201; Min Operating Temperature: -55°C; Max Operating Temperature: 125°C; Packaging: Tape and Reel; Value: 330R; Number of Terminations: 2; Tolerance: 0.5%; Features: Moisture Resistant; Series: RC; Length: 0.024inch; Width: 0.012inch; Height: 0.01inch; RoHS Compliant: Yes; ComponentLink1URL: http://www.yageo.com.tw/exep/pages/download/literatures/PYu-R_INT-thick_7.pdf?src-supplier=Digi-Key; ComponentLink1Description: http://www.yageo.com.tw/exep/pages/download/literatures/PYu-R_INT-thick_7.pdf?src-supplier=Digi-Key; Supplier Part Number 1: RC0201DR-07330RL-ND; LCSC Part Number: C851717
R31 = RC0201FR-0733RL: RES 33 OHM 1% 1/20W 0201; Manufacturer: Yageo; Item Type: Resistor; Supplier: Future Electronics; Supplier Part Number: 6199285; Manufacturer Part Number: RC0201FR-0733RL; RoHS: Yes; Category: Chip SMD Resistors; Stock: 1420000; Pricing: 10000=0.0013, 50000=0.0012, 250000=0.0012, 750000=0.0011, 2000000=0.001 (USD); ComponentLink1URL: https://datasheet.ciiva.com/2560/pyu-r-int-thick-7-2560877.pdf?src-supplier=Digi-Key; ComponentLink1Description: https://datasheet.ciiva.com/2560/pyu-r-int-thick-7-2560877.pdf?src-supplier=Digi-Key; ComponentLink2URL: https://datasheet.ciiva.com/2560/pyu-r-int-thick-7-2560878.pdf?src-supplier=Digi-Key; ComponentLink2Description: https://datasheet.ciiva.com/2560/pyu-r-int-thick-7-2560878.pdf?src-supplier=Digi-Key; ComponentLink3URL: https://datasheet.ciiva.com/2560/pyu-r-int-thick-7-2560879.pdf?src-supplier=Digi-Key; ComponentLink3Description: https://datasheet.ciiva.com/2560/pyu-r-int-thick-7-2560879.pdf?src-supplier=Digi-Key; ComponentLink4URL: https://datasheet.ciiva.com/7672/1563626-7672223.pdf?src-supplier=Element14; ComponentLink4Description: https://datasheet.ciiva.com/7672/1563626-7672223.pdf?src-supplier=Element14; ComponentLink5URL: https://datasheet.ciiva.com/22698/1563626-22698520.pdf?src-supplier=Element14; ComponentLink5Description: https://datasheet.ciiva.com/22698/1563626-22698520.pdf?src-supplier=Element14; LCSC Part Number: C295794
R32 = RC0201FR-0710KL: RES SMD 10K OHM 1% 1/20W 0201; Manufacturer: Yageo; Item Type: Resistor; Manufacturer Part Number: RC0201FR-0710KL; Package: 0201; ComponentLink7Description: LCSC; ComponentLink7URL: https://www.lcsc.com/product-detail/Chip-Resistor-Surface-Mount_YAGEO-RC0201FR-0710KL_C106225.html; LCSC Part Number: C106225

## Nets that join several sheets
3V3: Power-Sheet (6 pins), Stepper-Sheet (5 pins), Connector-Sheet (J6.A1 J6.A2)
12V: Power-Sheet (10 pins), Stepper-Sheet (C11.2 C16.2 U3.3 U3.4), Connector-Sheet (D6.2 J2.1)
GND: Power-Sheet (17 pins), Stepper-Sheet (25 pins), Connector-Sheet (25 pins)
VIN: Power-Sheet (D1.2), Connector-Sheet (J1.1)
VM: Power-Sheet (5 pins), Stepper-Sheet (15 pins)
BMA1: Stepper-Sheet (6 pins), Connector-Sheet (J7.4)
BMA2: Stepper-Sheet (6 pins), Connector-Sheet (J7.3)
BMB1: Stepper-Sheet (6 pins), Connector-Sheet (J7.2)
BMB2: Stepper-Sheet (6 pins), Connector-Sheet (J7.1)
DRV-CS: Stepper-Sheet (U3.13), Connector-Sheet (J6.A15)
DRV-DIAG0: Stepper-Sheet (R4.2 U3.26), Connector-Sheet (J6.B10)
DRV-DIAG1: Stepper-Sheet (R5.2 U3.27), Connector-Sheet (J6.A9)
DRV-DIR: Stepper-Sheet (U3.18), Connector-Sheet (J6.A11)
DRV-EN: Stepper-Sheet (U3.28), Connector-Sheet (J6.B11)
DRV-MISO: Stepper-Sheet (U3.16), Connector-Sheet (J6.B14)
DRV-MOSI: Stepper-Sheet (U3.15), Connector-Sheet (J6.B15)
DRV-SCK: Stepper-Sheet (U3.14), Connector-Sheet (J6.A14)
DRV-STEP: Stepper-Sheet (U3.17), Connector-Sheet (J6.A10)